# Altium project pca20072.PrjPCB (part 1 of 2)
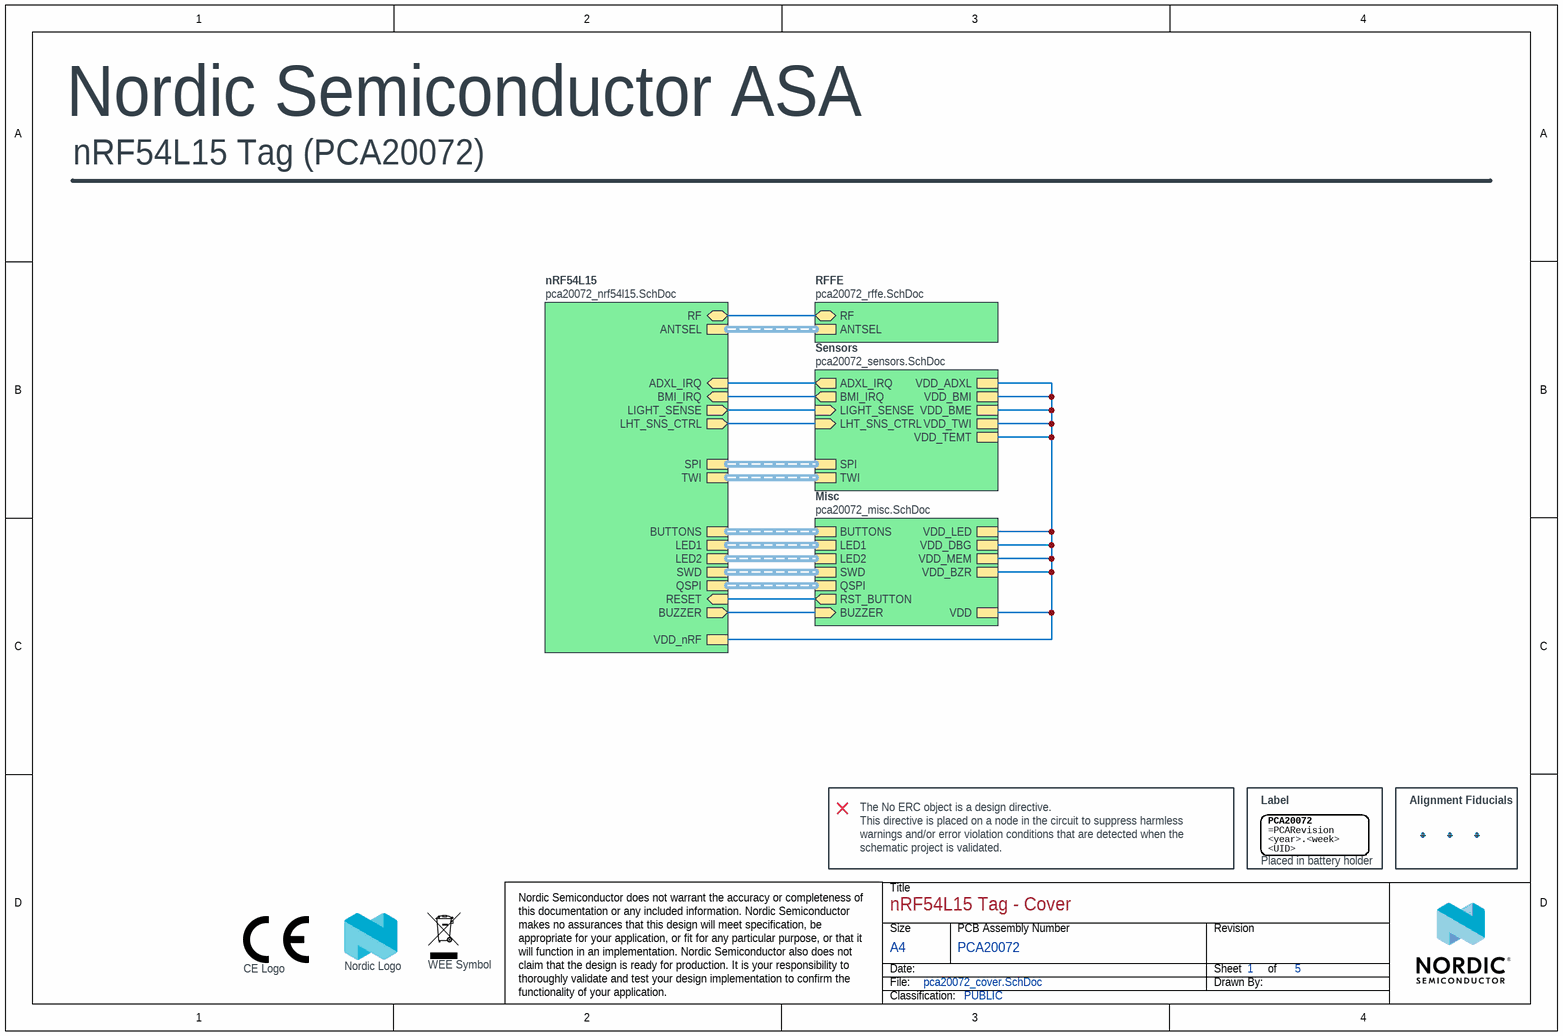
[diagram p0: pca20072_cover.SchDoc]
BoardThickness: 0.8mm; BoardTitle: nRF54L15 Tag; Classification: PUBLIC; Compliance: RoHS, REACH, Halogen-Free; Designer: RUBR; Dielectric: FR-4; NrOfLayers: 4; Organization: Nordic Semiconductor; PCAName: PCA20072; PCARevision: 1.0.0; PCBNumber: 400921; PCBRevision: 0491RUBR; PCBStackup: 4003; ProductName: nRF54L15-TAG; ProjectName: nRF54L15-TAG; SilkscreenColor: White; SoldermaskColor: Blue; SurfaceFinish: ENIG Gold
5 sheets, 113 parts. Net scope: hierarchical (ports join the sheet entries above them; power ports are global).
Board file: 400921.PcbDoc
Sheets:
  pca20072_cover.SchDoc
    nRF54L15 = pca20072_nrf54l15.SchDoc
    RFFE = pca20072_rffe.SchDoc
    Sensors = pca20072_sensors.SchDoc
    Misc = pca20072_misc.SchDoc

## Sheet pca20072_cover.SchDoc: nRF54L15 Tag - Cover
size A4; Organization: Nordic Semiconductor; DocumentNumber: 1; Revision: 1.0.0; SheetNumber: 1; SheetTotal: 5; Author: RUBR; CompanyName: Nordic Semiconductor; DrawnBy: RUBR; DocumentSize: A4; ProjectName: nRF54L15-TAG

### Parts
Fid1  Fiducial mark  [Fiducial]  (value not drawn)
Fid2  Fiducial mark  [Fiducial]  (value not drawn)
Fid3  Fiducial mark  [Fiducial]  (value not drawn)
LABEL1  Assembly: Placed in battery holder  [LabelSilk_8x8]  (hidden comment: 8x8mm)
LOGO1  WEE Symbol  [WEEE_3x4.5mm]  (no BOM)
LOGO2  Nordic Logo  [NORDIC_LOGO_LYING]  (no BOM)
LOGO3  CE Logo  [CE_logo]  (no BOM)

### Blocks framed on the sheet
Label: LABEL1
Alignment Fiducials: Fid1-Fid3

### Sub-sheets
Misc = pca20072_misc.SchDoc: BUTTONS (harness BUTTON), QSPI (harness QSPI), LED1 (harness LED), SWD (harness SWD), VDD_MEM, VDD_LED, VDD_DBG, LED2 (harness LED), BUZZER (in), VDD_BZR, RST_BUTTON (out), VDD
nRF54L15 = pca20072_nrf54l15.SchDoc: BUTTONS (harness BUTTON), LED1 (harness LED), SWD (harness SWD), RESET (in), RF (bidir), ANTSEL (harness ANT), QSPI (harness QSPI), ADXL_IRQ (in), BMI_IRQ (in), SPI (harness SPI), TWI (harness TWI), VDD_nRF, LHT_SNS_CTRL (out), LED2 (harness LED), LIGHT_SENSE (out), BUZZER (out)
RFFE = pca20072_rffe.SchDoc: RF (bidir), ANTSEL (harness ANT)
Sensors = pca20072_sensors.SchDoc: ADXL_IRQ (out), BMI_IRQ (out), SPI (harness SPI), TWI (harness TWI), VDD_BMI, VDD_ADXL, VDD_BME, VDD_TWI, LIGHT_SENSE (in), LHT_SNS_CTRL (in), VDD_TEMT

### Nets
P0.03: sheet nRF54L15/ADXL_IRQ, sheet Sensors/ADXL_IRQ
P1.04: sheet nRF54L15/BMI_IRQ, sheet Sensors/BMI_IRQ
P1.13: sheet nRF54L15/BUZZER, sheet Misc/BUZZER
P1.14: sheet nRF54L15/LIGHT_SENSE, sheet Sensors/LIGHT_SENSE
P2.06: sheet nRF54L15/LHT_SNS_CTRL, sheet Sensors/LHT_SNS_CTRL
RESET: sheet nRF54L15/RESET, sheet Misc/RST_BUTTON
RF: sheet nRF54L15/RF, sheet RFFE/RF
VDD: sheet nRF54L15/VDD_nRF, sheet Sensors/VDD_BMI, sheet Sensors/VDD_ADXL, sheet Sensors/VDD_BME, sheet Sensors/VDD_TWI, sheet Sensors/VDD_TEMT, sheet Misc/VDD_MEM, sheet Misc/VDD_LED, sheet Misc/VDD_DBG, sheet Misc/VDD_BZR, sheet Misc/VDD

### Buses and harness runs
harness sheet Misc/BUTTONS = sheet nRF54L15/BUTTONS
harness sheet Misc/LED1 = sheet nRF54L15/LED1
harness sheet Misc/LED2 = sheet nRF54L15/LED2
harness sheet Misc/QSPI = sheet nRF54L15/QSPI
harness sheet Misc/SWD = sheet nRF54L15/SWD
harness sheet nRF54L15/ANTSEL = sheet RFFE/ANTSEL
harness sheet nRF54L15/SPI = sheet Sensors/SPI
harness sheet nRF54L15/TWI = sheet Sensors/TWI

### Notes on the sheet
- (near LABEL1) The No ERC object is a design directive.
  This directive is placed on a node in the circuit to suppress harmless warnings and/or error violation conditions that are detected when the schematic project is validated.
- Nordic Semiconductor ASA
- Title
- Size
- Date:
- File:
- A4
- PCB Assembly Number
- Sheet
- Drawn By:
- Revision
- of
- Nordic Semiconductor does not warrant the accuracy or completeness of this documentation or any included information. Nordic Semiconductor makes no assurances that this design will meet specification, be appropriate for your application, or fit for any particular purpose, or that it will function in an implementation. Nordic Semiconductor also does not claim that the design is ready for production. It is your responsibility to thoroughly validate and test your design implementation to confirm the functionality of your application.
  © Nordic Semiconductor — All rights reserved.
- Classification:
- (in symbol Label_8x8) <year>.<week>; <UID>

### Library data of the parts
Fid1-Fid3 = Fid-Mark: Manufacturer: N.A.; Part number NEMS: 100500073; Value: N.A.; Pad Count: 1; Component Status: Active; System: Connector; Part Number: Fid-Mark; Manufacturer Part Number: N.A.; LatestRevisionDate: 2009-12-12; Published: 2009-12-12; Note: N.A.; Artikkelnr Noca: N.A.; Footprint Doc: Fiducial; PartId: 100500073; Component Class: Connectors; Author: rsk; ComponentLink1URL: N.A.; ComponentLink1Description: Datasheet; ComponentLink2URL: N.A.; ComponentLink2Description: Supplier link; HelpURL: N.A.; Supplier 1: N.A.; Supplier Part Number 1: N.A.; Supplier 2: N.A.; Supplier Part Number 2: N.A.; Part number IPS: N.A.; Part number Norautron: N.A.
LABEL1 = Label_8x8: PCA version label, stick-on, 8x8mm; Manufacturer: Ellco Etikett; Manufacturer Part Number: A33511-01; Part number NEMS: 101200025; Component Status: Active; Pad Count: 0; Note: N.A.; Part Number: Label_8x8; PartId: 101200025; Component Class: Mechanicals; Author: hany; ComponentLink1URL: N.A.; ComponentLink1Description: Datasheet; ComponentLink2URL: N.A.; ComponentLink2Description: Supplier link; HelpURL: N.A.; LatestRevisionDate: 2023-01-05; Published: 2023-01-05; Footprint Doc: Label; Value: 8x8mm; Supplier 1: N.A.; Supplier Part Number 1: N.A.; Supplier 2: N.A.; Supplier Part Number 2: N.A.; Artikkelnr Noca: N.A.; Part number IPS: N.A.; Part number Norautron: N.A.
LOGO1 = WEEE Symbol 3x4.5mm: WEEE Directive symbol; Manufacturer: N.A.; Part number NEMS: 101100006; Component Status: Active; Pad Count: 0; Part Number: WEEE Symbol 3x4.5mm; PartId: 101100006; Component Class: Markings; Author: rsk; Manufacturer Part Number: N.A.; ComponentLink1URL: N.A.; ComponentLink1Description: Datasheet; ComponentLink2URL: N.A.; ComponentLink2Description: Supplier link; HelpURL: N.A.; LatestRevisionDate: 2023-03-07; Published: 2016-09-07; Footprint Doc: WEEE_3x4.5mm; Value: WEE Symbol; Note: N.A.; Supplier 1: N.A.; Supplier Part Number 1: N.A.; Supplier 2: N.A.; Supplier Part Number 2: N.A.; Artikkelnr Noca: N.A.; Part number IPS: N.A.; Part number Norautron: N.A.
LOGO2 = Nordic Logo lying: Manufacturer: N.A.; Part number NEMS: 101100001; Component Status: Active; Pad Count: 0; Part Number: Nordic Logo lying; PartId: 101100001; Component Class: Markings; Author: rsk; Manufacturer Part Number: N.A.; ComponentLink1URL: N.A.; ComponentLink1Description: Datasheet; ComponentLink2URL: N.A.; ComponentLink2Description: Supplier link; HelpURL: N.A.; LatestRevisionDate: 2017-03-20; Published: 2017-09-01; Footprint Doc: Nordic Logo; Value: Nordic Logo; Note: N.A.; Supplier 1: N.A.; Supplier Part Number 1: N.A.; Supplier 2: N.A.; Supplier Part Number 2: N.A.; Artikkelnr Noca: N.A.; Part number IPS: N.A.; Part number Norautron: N.A.
LOGO3 = CE_logo: CE (Conformité_Européenne) logo; Manufacturer: N.A.; Part number NEMS: 101100010; Component Status: Active; Pad Count: 0; Part Number: CE_logo; PartId: 101100010; Component Class: Markings; Author: daba; Manufacturer Part Number: N.A.; ComponentLink1URL: N.A.; ComponentLink1Description: Datasheet; ComponentLink2URL: N.A.; ComponentLink2Description: Supplier link; HelpURL: N.A.; LatestRevisionDate: 2024-11-26; Published: 2024-11-26; Footprint Doc: CE_logo; Value: CE Logo; Note: N.A.; Supplier 1: N.A.; Supplier Part Number 1: N.A.; Supplier 2: N.A.; Supplier Part Number 2: N.A.; Artikkelnr Noca: N.A.; Part number IPS: N.A.; Part number Norautron: N.A.

## Sheet pca20072_nrf54l15.SchDoc: =BoardTitle+' - nRF54L15'
size A4; Organization: Nordic Semiconductor; DocumentNumber: 2; Revision: 1.0.0; SheetNumber: 2; SheetTotal: 5; Author: RUBR; CompanyName: Nordic Semiconductor; DrawnBy: RUBR; DocumentSize: A4; ProjectName: nRF54L15-TAG
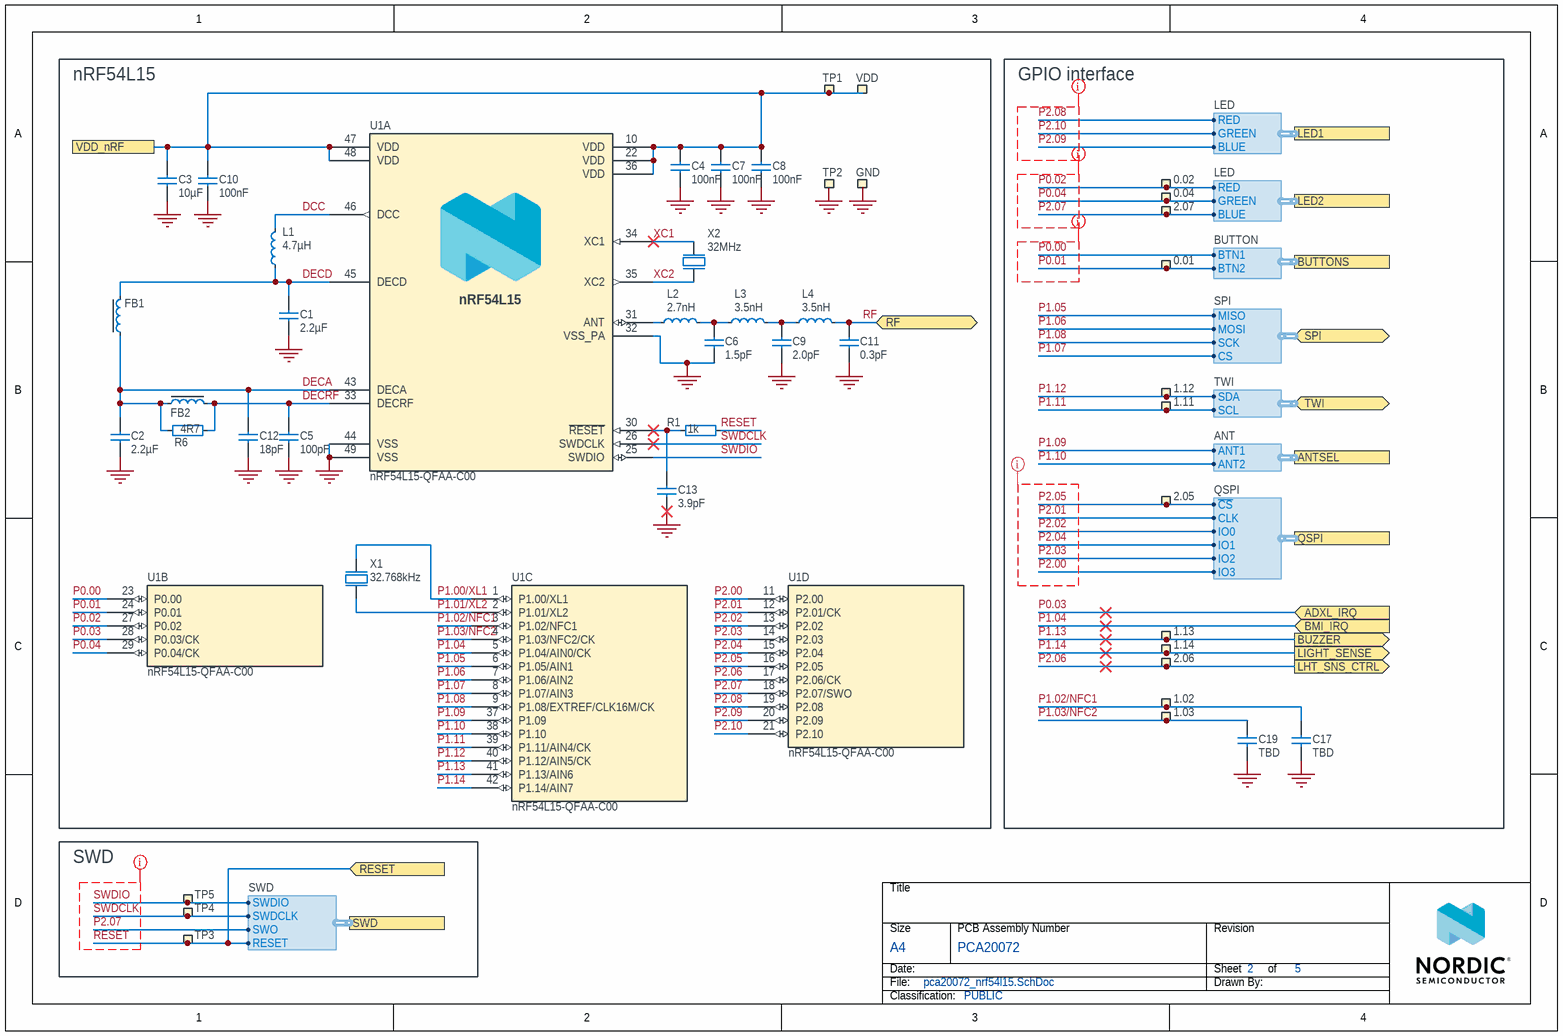
[diagram p1: pca20072_nrf54l15.SchDoc]

### Parts
0.01  TP  [TESTPAD-TH]  (value not drawn)  (no BOM)
0.02  TP  [TESTPAD-TH]  (value not drawn)  (no BOM)
0.04  TP  [TESTPAD-TH]  (value not drawn)  (no BOM)
1.02  TP  [TESTPAD-TH]  (value not drawn)  (no BOM)
1.03  TP  [TESTPAD-TH]  (value not drawn)  (no BOM)
1.11  TP  [TESTPAD-TH]  (value not drawn)  (no BOM)
1.12  TP  [TESTPAD-TH]  (value not drawn)  (no BOM)
1.13  TP  [TESTPAD-TH]  (value not drawn)  (no BOM)
1.14  TP  [TESTPAD-TH]  (value not drawn)  (no BOM)
2.05  TP  [TESTPAD-TH]  (value not drawn)  (no BOM)
2.06  TP  [TESTPAD-TH]  (value not drawn)  (no BOM)
2.07  TP  [TESTPAD-TH]  (value not drawn)  (no BOM)
C1  2.2µF  [CAPC0603X03L_C]
C2  2.2µF  [CAPC0603X03L_C]
C3  10µF  [CAPC1005X04L_C2]
C4  100nF  [CAPC0603X03L_C]
C5  100pF  [CAPC0603X03L_C]
C6  1.5pF  [CAPC0603X03L_C]
C7  100nF  [CAPC0603X03L_C]
C8  100nF  [CAPC0603X03L_C]
C9  2.0pF  [CAPC0603X03L_C]
C10  100nF  [CAPC0603X03L_C]
C11  0.3pF  [CAPC0603X03L_C]
C12  18pF  [CAPC0603X03L_C]
C13  3.9pF  [CAPC0603X03L_C]
C17  TBD  [CAPC1005X04L]
C19  TBD  [CAPC1005X04L]
FB1  120R/0.2A  [INDC0603X03L_C]  (value not drawn)
FB2  120R/0.2A  [INDC0603X03L_C]  (value not drawn)
GND  TP  [TESTPAD-TH]  (value not drawn)  (no BOM)
L1  4.7µH  [INDC1608X06L]
L2  2.7nH  [INDC0603X03L_C]
L3  3.5nH  [INDC0603X03L_C]
L4  3.5nH  [INDC0603X03L_C]
R1  1k  [RESC0603X03L_C]
R6  4R7  [RESC0603X03L_C]
TP1  Ø1.5mm,SMD  [TP_SMD_D1.5mm]  (value not drawn)  (no BOM)
TP2  Ø1.5mm,SMD  [TP_SMD_D1.5mm]  (value not drawn)  (no BOM)
TP3  Ø1.5mm,SMD  [TP_SMD_D1.5mm]  (value not drawn)  (no BOM)
TP4  Ø1.5mm,SMD  [TP_SMD_D1.5mm]  (value not drawn)  (no BOM)
TP5  Ø1.5mm,SMD  [TP_SMD_D1.5mm]  (value not drawn)  (no BOM)
U1  nRF54L15-QFAA-C00  [QFN40P600X600X90-48N]  (parts A,B,C,D of 4)
VDD  TP  [TESTPAD-TH]  (value not drawn)  (no BOM)
X1  32.768kHz  [XTAL_2012]
X2  32MHz  [BT-XTAL_2016]

### Blocks framed on the sheet
nRF54L15: C1-C13 FB1 FB2 GND L1-L4 R1 R6 TP1 TP2 U1 VDD X1 X2
GPIO interface: 0.01 0.02 0.04 1.02 1.03 1.11-1.14 2.05 2.06 2.07 C17 C19
SWD: TP3-TP5

### Ports
ADXL_IRQ (in), ANTSEL (harness ANT), BMI_IRQ (in), BUTTONS (harness BUTTON), BUZZER (out), LED1 (harness LED), LED2 (harness LED), LHT_SNS_CTRL (out), LIGHT_SENSE (out), QSPI (harness QSPI), RESET (in), RF (bidir), SPI (bidir, harness SPI), SWD (harness SWD), TWI (bidir, harness TWI), VDD_nRF

### Harnesses
SWD: SWDIO, SWDCLK, SWO, RESET
LED: GREEN, RED, BLUE
BUTTON: BTN2, BTN1
ANT: ANT2, ANT1
QSPI: ~{CS}, IO0, CLK, IO1, IO2, IO3
SPI: MISO, MOSI, SCK, CS
TWI: SCL, SDA

### Nets
GND: C1.1 C2.1 C3.1 C4.2 C5.1 C6.1 C7.2 C8.2 C9.1 C10.2 C11.1 C12.1 C13.1 C17.2 C19.2 GND.1 TP2.1 U1.32(VSS_PA) U1.44(VSS) U1.49(VSS) X2.2(GND) X2.4(GND)
DCC: L1.1 U1.46(DCC)
DECA: C2.2 C12.2 FB1.2 FB2.2 R6.2 U1.43(DECA)
DECD: C1.2 FB1.1 L1.2 U1.45(DECD)
DECRF: C5.2 FB2.1 R6.1 U1.33(DECRF)
P0.00: U1.23(P0.00) ; port BUTTONS.BTN1
P0.01: 0.01.1 U1.24(P0.01) ; port BUTTONS.BTN2
P0.02: 0.02.1 U1.27(P0.02) ; port LED2.RED
P0.03: U1.28(P0.03/CK) ; port ADXL_IRQ
P0.04: 0.04.1 U1.29(P0.04/CK) ; port LED2.GREEN
P1.00/XL1: U1.1(P1.00/XL1) X1.2(out)
P1.01/XL2: U1.2(P1.01/XL2) X1.1(inp)
P1.02/NFC1: 1.02.1 C17.1 U1.3(P1.02/NFC1)
P1.03/NFC2: 1.03.1 C19.1 U1.4(P1.03/NFC2/CK)
P1.04: U1.5(P1.04/AIN0/CK) ; port BMI_IRQ
P1.05: U1.6(P1.05/AIN1) ; port SPI.MISO
P1.06: U1.7(P1.06/AIN2) ; port SPI.MOSI
P1.07: U1.8(P1.07/AIN3) ; port SPI.CS
P1.08: U1.9(P1.08/EXTREF/CLK16M/CK) ; port SPI.SCK
P1.09: U1.37(P1.09) ; port ANTSEL.ANT1
P1.10: U1.38(P1.10) ; port ANTSEL.ANT2
P1.11: 1.11.1 U1.39(P1.11/AIN4/CK) ; port TWI.SCL
P1.12: 1.12.1 U1.40(P1.12/AIN5/CK) ; port TWI.SDA
P1.13: 1.13.1 U1.41(P1.13/AIN6) ; port BUZZER
P1.14: 1.14.1 U1.42(P1.14/AIN7) ; port LIGHT_SENSE
P2.00: U1.11(P2.00) ; port QSPI.IO3
P2.01: U1.12(P2.01/CK) ; port QSPI.CLK
P2.02: U1.13(P2.02) ; port QSPI.IO0
P2.03: U1.14(P2.03) ; port QSPI.IO2
P2.04: U1.15(P2.04) ; port QSPI.IO1
P2.05: 2.05.1 U1.16(P2.05) ; port QSPI.~{CS}
P2.06: 2.06.1 U1.17(P2.06/CK) ; port LHT_SNS_CTRL
P2.07: 2.07.1 U1.18(P2.07/SWO) ; port SWD.SWO, port LED2.BLUE
P2.08: U1.19(P2.08) ; port LED1.RED
P2.09: U1.20(P2.09) ; port LED1.BLUE
P2.10: U1.21(P2.10) ; port LED1.GREEN
RESET: R1.2 TP3.1 ; port RESET, port SWD.RESET
RF: C11.2 L4.2 ; port RF
SWDCLK: TP4.1 U1.26(SWDCLK) ; port SWD.SWDCLK
SWDIO: TP5.1 U1.25(SWDIO) ; port SWD.SWDIO
VDD: C3.2 C4.1 C7.1 C8.1 C10.1 TP1.1 U1.10(VDD) U1.22(VDD) U1.36(VDD) U1.47(VDD) U1.48(VDD) VDD.1 ; port VDD_nRF
XC1: U1.34(XC1) X2.1(inp)
XC2: U1.35(XC2) X2.3(out)
NetC6_2: C6.2 L2.2 L3.1
NetC9_2: C9.2 L3.2 L4.1
NetC13_2: C13.2 R1.1 U1.30(~{RESET})
NetL2_1: L2.1 U1.31(ANT)

### Layout directives
net class GPIO: P0.00, P0.01, P0.02, P0.04, P2.07, P2.08, P2.09, P2.10
net class SWD_nRF54: P2.07, RESET, SWDCLK, SWDIO
net class QSPI: P2.00, P2.01, P2.02, P2.03, P2.04, P2.05

### Notes on the sheet
- Title
- Size
- Date:
- File:
- A4
- PCB Assembly Number
- Sheet
- Drawn By:
- Revision
- of
- Classification:
- (in symbol nRF54L15-QFAA-C00, part A) nRF54L15

### Library data of the parts
0.01 0.02 0.04 1.02 1.03 1.11-1.14 2.05 2.06 2.07 GND VDD = Testpoint TH: Testpoint, through hole; Manufacturer: N.A.; Part number NEMS: 100500464; Component Status: Active; Pad Count: 1; Part Number: Testpoint TH; PartId: 100500464; Component Class: Connectors; Author: rsk; Manufacturer Part Number: N.A.; ComponentLink1URL: N.A.; ComponentLink1Description: Datasheet; ComponentLink2URL: N.A.; ComponentLink2Description: Supplier link; HelpURL: N.A.; LatestRevisionDate: 2009-12-12; Published: 2009-12-12; Footprint Doc: TESTPAD-TH; Value: TP; Note: N.A.; Supplier 1: N.A.; Supplier Part Number 1: N.A.; Supplier 2: N.A.; Supplier Part Number 2: N.A.; Artikkelnr Noca: N.A.; Part number IPS: N.A.; Part number Norautron: N.A.
C1 C2 = C0201-2µ2-2.5V-X6T-GRM033D80E225ME47D: Capacitor, Ceramic, 2.2µF 2.5V X6T 0201,±20%; Manufacturer: Murata; Part number NEMS: 100200527; Component Status: Active; Pad Count: 2; Note: 2.5V, 20%, X6T; Artikkelnr Noca: N.A.; Part Number: C0201-2µ2-2.5V-X6T-GRM033D80E225ME47D; Component Class: Capacitors; Author: stl1; Manufacturer Part Number: GRM033D80E225ME47D; ComponentLink1URL: https://www.murata.com/products/productdetail?partno=GRM033D80E225ME47%23; ComponentLink1Description: Datasheet; ComponentLink2URL: N.A.; ComponentLink2Description: Supplier link; HelpURL: N.A.; LatestRevisionDate: 2022-02-27; Published: 2022-02-27; Footprint Doc: 0201; Value: 2.2µF; Supplier 1: Mouser; Supplier Part Number 1: 81-GRM033D80E225ME7D; Supplier 2: DigiKey; Supplier Part Number 2: 490-18653-1-ND; Part number IPS: N.A.; Part number Norautron: N.A.; PartId: 100200527
C3 = C0402-10µ-6.3V-X5R-GRM155R60J106ME05D: Capacitor, X5R, ±20%, 6.3V; Manufacturer: Murata; Part number NEMS: 100200554; Component Status: Active; Pad Count: 2; Artikkelnr Noca: N.A.; Part Number: C0402-10µ-6.3V-X5R-GRM155R60J106ME05D; PartId: 100200554; Component Class: Capacitors; Author: eisk; Manufacturer Part Number: GRM155R60J106ME05D; ComponentLink1URL: https://www.murata.com/products/productdetail?partno=GRM155R60J106ME05%23; ComponentLink1Description: Datasheet; ComponentLink2URL: N.A.; ComponentLink2Description: Supplier link; HelpURL: https://www.murata.com/products/productdetail?partno=GRM155R60J106ME05%23; LatestRevisionDate: 2023-08-01; Published: 2023-08-01; Footprint Doc: 0402; Value: 10µF; Note: 6.3V; Supplier 1: DigiKey; Supplier Part Number 1: 490-GRM155R60J106ME05DTR-ND; Supplier 2: Mouser; Supplier Part Number 2: 81-GRM155C81C225KE1D; Part number IPS: N.A.; Part number Norautron: N.A.
C4 C7 C8 C10 = C0201-100n: Capacitor, X5R, ±10%, 100nF, 16V; Manufacturer: N.A.; Part number IPS: 00000001248, 00000002505; Part number Norautron: 262071862; Part number NEMS: 100200078; Pad Count: 2; Component Status: Active; Part Number: C0201-100n; Manufacturer Part Number: N.A.; Footprint Doc: 0201; LatestRevisionDate: 2024-06-27; Published: 2014-11-13; Value: 100nF; Note: 16V; Artikkelnr Noca: N.A.; ComponentLink1URL: N.A.; ComponentLink1Description: Datasheet; ComponentLink2URL: N.A.; ComponentLink2Description: Supplier link; HelpURL: N.A.; Supplier 1: N.A.; Supplier Part Number 1: N.A.; Supplier 2: N.A.; Supplier Part Number 2: N.A.; Component Class: Capacitors; Author: rsk; PartId: 100200078
C5 = C0201-100p: Capacitor, NP0, ±2%, 25V; Manufacturer: Murata; Manufacturer Part Number: GRM0335C1E101GA01D; Part number IPS: 00000007853; Part number NEMS: 100200044; Component Status: Active; Pad Count: 2; Artikkelnr Noca: N.A.; Part Number: C0201-100p; PartId: 100200044; Component Class: Capacitors; Author: rsk; ComponentLink1URL: N.A.; ComponentLink1Description: Datasheet; ComponentLink2URL: N.A.; ComponentLink2Description: Supplier link; HelpURL: N.A.; LatestRevisionDate: 2019-04-16; Published: 2019-04-16; Footprint Doc: 0201; Value: 100pF; Note: 25V; Supplier 1: N.A.; Supplier Part Number 1: N.A.; Supplier 2: N.A.; Supplier Part Number 2: N.A.; Part number Norautron: N.A.
C6 = C0201-1.5p-25V-NP0-GJM0335C1E1R5WB01: Capacitor, NP0, ±0.05pF, 25V, High Q; Manufacturer: Murata; Part number NEMS: 100200477; Component Status: Active; Pad Count: 2; Artikkelnr Noca: N.A.; Part Number: C0201-1.5p-25V-NP0-GJM0335C1E1R5WB01; PartId: 100200477; Component Class: Capacitors; Author: masi; Manufacturer Part Number: GJM0335C1E1R5WB01; ComponentLink1URL: https://search.murata.co.jp/Ceramy/image/img/A01X/G101/ENG/GJM0335C1E1R5WB01-01.pdf; ComponentLink1Description: Datasheet; ComponentLink2URL: N.A.; ComponentLink2Description: Supplier link; HelpURL: https://www.murata.com/products/productdetail?partno=GJM0335C1E1R5WB01%23; LatestRevisionDate: 2021-06-15; Published: 2021-06-15; Footprint Doc: 0201; Value: 1.5pF; Note: 25V; Supplier 1: DigiKey; Supplier Part Number 1: 490-11176-2-ND; Supplier 2: Mouser; Supplier Part Number 2: 81-GJM0335C1E1R5WB1D; Part number IPS: N.A.; Part number Norautron: N.A.
C9 = C0201-2.0p-HQ-Murata: Capacitor, NP0, ±0.05pF, 25V; Manufacturer: Murata; Manufacturer Part Number: GJM0335C1E2R0WB01; Part number IPS: 00000001775; Part number NEMS: 100200419; Component Status: Active; Pad Count: 2; Artikkelnr Noca: N.A.; Part Number: C0201-2.0p-HQ-Murata; PartId: 100200419; Component Class: Capacitors; Author: rsk; ComponentLink1URL: N.A.; ComponentLink1Description: Datasheet; ComponentLink2URL: N.A.; ComponentLink2Description: Supplier link; HelpURL: https://psearch.en.murata.com/capacitor/product/GJM0335C1E2R0WB01%23.html; LatestRevisionDate: 2018-10-25; Published: 2018-10-25; Footprint Doc: 0201; Value: 2.0pF; Note: 25V; Supplier 1: N.A.; Supplier Part Number 1: N.A.; Supplier 2: N.A.; Supplier Part Number 2: N.A.; Part number Norautron: N.A.
C11 = C0201-0.3p-50V-GRM0335C1HR30BA01: Capacitor, C0G, ±0.1pF, 50V; Manufacturer: Murata; Part number NEMS: 100200650; Component Status: Active; Pad Count: 2; Artikkelnr Noca: N.A.; Part Number: C0201-0.3p-50V-GRM0335C1HR30BA01; PartId: 100200650; Component Class: Capacitors; Author: masi; Manufacturer Part Number: GRM0335C1HR30BA01; ComponentLink1URL: https://www.murata.com/en-global/products/productdetail?partno=GRM0335C1HR30BA01%23; ComponentLink1Description: Datasheet; ComponentLink2URL: N.A.; ComponentLink2Description: Supplier link; HelpURL: N.A.; LatestRevisionDate: 2024-01-10; Published: 2024-01-10; Footprint Doc: 0201; Value: 0.3pF; Note: 50V; Supplier 1: DigiKey; Supplier Part Number 1: 490-6135-2-ND; Supplier 2: Mouser; Supplier Part Number 2: 81-GRM0335C1HR30BA1D; Part number IPS: N.A.; Part number Norautron: N.A.
C12 = C0201-18p: Capacitor, C0G, ±5%, 25V; Manufacturer: Walsin Technology Corporation; Manufacturer Part Number: 0201N180J250CT; Part number IPS: 00000000862; Part number Norautron: 26207023; Part number NEMS: 100200035; Component Status: Active; Pad Count: 2; Note: Chip Cap 5%; Artikkelnr Noca: N.A.; Part Number: C0201-18p; PartId: 100200035; Component Class: Capacitors; Author: rsk; ComponentLink1URL: N.A.; ComponentLink1Description: Datasheet; ComponentLink2URL: N.A.; ComponentLink2Description: Supplier link; HelpURL: N.A.; LatestRevisionDate: 2020-10-13; Published: 2014-11-13; Footprint Doc: 0201; Value: 18pF; Supplier 1: N.A.; Supplier Part Number 1: N.A.; Supplier 2: N.A.; Supplier Part Number 2: N.A.
C13 = C0201-3.9p: Chip Cap 0201; Manufacturer: N.A.; Part number NEMS: 100200024,100200424; Component Status: Active; Pad Count: 2; Note: Chip Cap 1%; Part Number: C0201-3.9p; PartId: 100200024; Component Class: Capacitors; Author: rsk; Manufacturer Part Number: N.A.; ComponentLink1URL: N.A.; ComponentLink1Description: Datasheet; ComponentLink2URL: N.A.; ComponentLink2Description: Supplier link; HelpURL: N.A.; LatestRevisionDate: 2014-11-13; Published: 2014-11-13; Footprint Doc: 0201; Value: 3.9pF; Supplier 1: N.A.; Supplier Part Number 1: N.A.; Supplier 2: N.A.; Supplier Part Number 2: N.A.; Artikkelnr Noca: N.A.; Part number IPS: N.A.; Part number Norautron: N.A.
C17 C19 = C0402-TBD: Chip Cap 0402; Manufacturer: N.A.; Part number NEMS: 100200106; Pad Count: 2; Component Status: Active; Part Number: C0402-TBD; Manufacturer Part Number: N.A.; Footprint Doc: 0402; LatestRevisionDate: 2010-12-21; Published: 2010-12-21; Value: TBD; Note: Chip Cap; Artikkelnr Noca: N.A.; Part number IPS: N.A.; ComponentLink1URL: N.A.; ComponentLink1Description: Datasheet; ComponentLink2URL: N.A.; ComponentLink2Description: Supplier link; HelpURL: N.A.; Supplier 1: N.A.; Supplier Part Number 1: N.A.; Supplier 2: N.A.; Supplier Part Number 2: N.A.; Component Class: Capacitors; PartId: 100200106; Author: rsk; Part number Norautron: N.A.
FB1 FB2 = FB0201-120R@100M-200mA-BLM03AG121SN1D: Ferrite Bead, 120 Ohm @ 100MHz, 200mA, 500 mOhm Max; Manufacturer: Murata; Part number NEMS: 100300419; Component Status: Active; Pad Count: 2; Artikkelnr Noca: N.A.; Part Number: FB0201-120R@100M-200mA-BLM03AG121SN1D; Component Class: Inductors; Author: stl1; Manufacturer Part Number: BLM03AG121SN1D; ComponentLink1URL: https://www.murata.com/en-eu/products/productdetail?partno=BLM03AG121SN1%23; ComponentLink1Description: Datasheet; ComponentLink2URL: N.A.; ComponentLink2Description: Supplier link; HelpURL: N.A.; LatestRevisionDate: 2022-02-27; Published: 2022-02-27; Footprint Doc: 0201; Value: 120R/0.2A; Note: Ferrite Bead; Supplier 1: DigiKey; Supplier Part Number 1: 490-5622-1-ND; Supplier 2: Mouser; Supplier Part Number 2: 81-BLM03AX121SN1D; Part number IPS: N.A.; Part number Norautron: N.A.; PartId: 100300419
L1 = L0603-4µ7-MLZ1608M4R7WT000: Inductor, 120mA, ±20%, 0.65R; Manufacturer: TDK Corporation; Part number NEMS: 100300440; Component Status: Active; Pad Count: 2; Note: Power Inductor ±20%; Artikkelnr Noca: N.A.; Part Number: L0603-4µ7-MLZ1608M4R7WT000; PartId: 100300440; Component Class: Inductors; Author: stl1; Manufacturer Part Number: MLZ1608M4R7WT000; ComponentLink1URL: https://product.tdk.com/en/search/inductor/inductor/smd/info?part_no=MLZ1608M4R7WT000; ComponentLink1Description: Datasheet; ComponentLink2URL: N.A.; ComponentLink2Description: Supplier link; HelpURL: N.A.; LatestRevisionDate: 2023-05-10; Published: 2023-05-10; Footprint Doc: 0603; Value: 4.7µH; Supplier 1: DigiKey; Supplier Part Number 1: 445-6390-2-ND; Supplier 2: Mouser; Supplier Part Number 2: 810-MLZ1608M4R7WT000; Part number IPS: N.A.; Part number Norautron: N.A.
L2 = L0201-2n7-HQ-Murata: Inductor, 600mA, ±0.1ｎH, 120mOhm; Manufacturer: Murata; Manufacturer Part Number: LQP03HQ2N7B02; Part number IPS: 00000001753; Part number NEMS: 100300214; Component Status: Active; Pad Count: 2; Note: -55°C ~ 125°C; Artikkelnr Noca: N.A.; Part Number: L0201-2n7-HQ-Murata; PartId: 100300214; Component Class: Inductors; Author: rsk; ComponentLink1URL: https://search.murata.co.jp/Ceramy/image/img/P02/JELF243C-0021.pdf; ComponentLink1Description: Datasheet; ComponentLink2URL: N.A.; ComponentLink2Description: Supplier link; HelpURL: https://psearch.en.murata.com/inductor/product/LQP03HQ2N7B02%23.html; LatestRevisionDate: 2018-10-23; Published: 2018-10-23; Footprint Doc: 0201; Value: 2.7nH; Supplier 1: DigiKey; Supplier Part Number 1: 490-13909-1-ND; Supplier 2: N.A.; Supplier Part Number 2: N.A.; Part number Norautron: N.A.
L3 L4 = L0201-3n5-HQ-Murata: Inductor, 500mA, ±0.1ｎH, 170mOhm; Manufacturer: Murata; Manufacturer Part Number: LQP03HQ3N5B02; Part number NEMS: 100300222; Component Status: Active; Pad Count: 2; Note: -55°C ~ 125°C; Artikkelnr Noca: N.A.; Part Number: L0201-3n5-HQ-Murata; PartId: 100300222; Component Class: Inductors; Author: rsk; ComponentLink1URL: https://search.murata.co.jp/Ceramy/image/img/P02/JELF243C-0021.pdf; ComponentLink1Description: Datasheet; ComponentLink2URL: N.A.; ComponentLink2Description: Supplier link; HelpURL: https://psearch.en.murata.com/inductor/product/LQP03HQ3N5B02%23.html; LatestRevisionDate: 2018-10-23; Published: 2018-10-23; Footprint Doc: 0201; Value: 3.5nH; Supplier 1: DigiKey; Supplier Part Number 1: 490-13925-1-ND; Supplier 2: N.A.; Supplier Part Number 2: N.A.; Part number IPS: N.A.; Part number Norautron: N.A.
R1 = R0201-1k0: Resistor, ±1%, 0.05W; Manufacturer: N.A.; Part number IPS: 00000005786; Part number NEMS: 100100043; Component Status: Active; Pad Count: 2; Note: Chip Res 1%; Part Number: R0201-1k0; PartId: 100100043; Component Class: Resistors; Author: rsk; Manufacturer Part Number: N.A.; ComponentLink1URL: N.A.; ComponentLink1Description: Datasheet; ComponentLink2URL: N.A.; ComponentLink2Description: Supplier link; HelpURL: N.A.; LatestRevisionDate: 2014-11-13; Published: 2014-11-13; Footprint Doc: 0201; Value: 1k; Supplier 1: N.A.; Supplier Part Number 1: N.A.; Supplier 2: N.A.; Supplier Part Number 2: N.A.; Artikkelnr Noca: N.A.; Part number Norautron: N.A.
R6 = R0201-4R7: Resistor, ±1%, 0.05W; Manufacturer: N.A.; Part number IPS: 00000002486; Part number NEMS: 100100010; Component Status: Active; Pad Count: 2; Note: Chip Res 1%; Part Number: R0201-4R7; PartId: 100100010; Component Class: Resistors; Author: rsk; Manufacturer Part Number: N.A.; ComponentLink1URL: N.A.; ComponentLink1Description: Datasheet; ComponentLink2URL: N.A.; ComponentLink2Description: Supplier link; HelpURL: N.A.; LatestRevisionDate: 2014-11-13; Published: 2014-11-13; Footprint Doc: 0201; Value: 4R7; Supplier 1: N.A.; Supplier Part Number 1: N.A.; Supplier 2: N.A.; Supplier Part Number 2: N.A.; Artikkelnr Noca: N.A.; Part number Norautron: N.A.
TP1-TP5 = TP_SMD_Ø1.5MM: 1.5mm circular SMD testpad; Manufacturer: Nordic Semiconductor; Manufacturer Part Number: N.A.; Part number NEMS: 100500477; Component Status: Active; Pad Count: 1; Part Number: TP_SMD_Ø1.5MM; PartId: 100500477; Component Class: Connectors; Author: rsk; ComponentLink1URL: N.A.; ComponentLink1Description: Datasheet; ComponentLink2URL: N.A.; ComponentLink2Description: Supplier link; HelpURL: N.A.; LatestRevisionDate: 2021-03-05; Published: 2016-06-02; Footprint Doc: TP_SMD_Ø1.5mm; Value: Ø1.5mm,SMD; Note: N.A.; Supplier 1: N.A.; Supplier Part Number 1: N.A.; Supplier 2: N.A.; Supplier Part Number 2: N.A.; Artikkelnr Noca: N.A.; Part number IPS: N.A.; Part number Norautron: N.A.
U1 = nRF54L15-QFAA-C00: Multi-protocol Bluetooth Low Energy, IEEE 802.15.4 and 2.4GHz proprietary Wireless MCU; Manufacturer: Nordic Semiconductor; Part number NEMS: 102000382; Component Status: Active; Pad Count: 49; Note: N.A.; Part Number: nRF54L15-QFAA-C00; PartId: 102000382; Component Class: Nordic_Devices; Author: stl1; Manufacturer Part Number: nRF54L15-QFAA-C00; ComponentLink1URL: N.A.; ComponentLink1Description: Datasheet; ComponentLink2URL: N.A.; ComponentLink2Description: Supplier link; HelpURL: N.A.; LatestRevisionDate: 2025-01-30; Published: 2025-01-30; Footprint Doc: QFN-48; Value: nRF54L15-QFAA-C00; Supplier 1: Nordic Semiconductor; Supplier Part Number 1: nRF54L15-QFAA-C00; Supplier 2: N.A.; Supplier Part Number 2: N.A.; Artikkelnr Noca: N.A.; Part number IPS: N.A.; Part number Norautron: N.A.
X1 = XTAL_SMD2012_32.768kHz_9pF_TXC: XTAL SMD 2012, 32.768kHz, 9pF, ±20ppm; Manufacturer: TXC Corporation; Manufacturer Part Number: 9HT11-32.768KDZC-T; Part number NEMS: 101600107; Component Status: Active; Pad Count: 2; Note: XTAL SMD 32.768kHz; Artikkelnr Noca: N.A.; Part Number: XTAL_SMD2012_32.768kHz_9pF_TXC; PartId: 101600107; Component Class: Oscillators; Author: eisk; ComponentLink1URL: http://www.txccrystal.com/images/pdf/9ht11.pdf; ComponentLink1Description: Datasheet; ComponentLink2URL: https://www.digikey.com/en/products/detail/9HT11-32.768KDZC-T/887-1426-1-ND/2403277; ComponentLink2Description: Supplier link; HelpURL: http://www.txccrystal.com/images/pdf/9ht11.pdf; LatestRevisionDate: 2023-03-14; Published: 2014-03-28; Footprint Doc: XTAL_2012; Value: 32.768kHz; Supplier 1: DigiKey; Supplier Part Number 1: 887-1426-2-ND; Supplier 2: Mouser; Supplier Part Number 2: 717-9HT11-32.7KDZC-T; Part number IPS: N.A.; Part number Norautron: N.A.
X2 = XTAL_SMD2016_32MHz_8pF_Kyocera: XTAL SMD 2016, 32MHz, Cl=8pF, Tot: ±40ppm; Manufacturer Part Number: CX2016DB32000D0WZRC1; Part number IPS: 00000007827; Part number Norautron: 26511136; Part number NEMS: 101600039; Component Status: Active; Pad Count: 4; Note: XTAL SMD 32.000MHz; Artikkelnr Noca: 22010022; Part Number: XTAL_SMD2016_32MHz_8pF_Kyocera; PartId: 101600039; Component Class: Oscillators; Author: rsk; Manufacturer: Kyocera; ComponentLink1URL: N.A.; ComponentLink1Description: Datasheet; ComponentLink2URL: N.A.; ComponentLink2Description: Supplier link; HelpURL: http://media.digikey.com/pdf/Data%20Sheets/AVX%20PDFs/CX2016DB32000D0WZRC1_Spec.pdf; LatestRevisionDate: 2016-06-02; Published: 2015-10-15; Footprint Doc: XTAL_2016; Value: 32MHz; Supplier 1: DigiKey; Supplier Part Number 1: 1253-1586-1-ND; Supplier 2: N.A.; Supplier Part Number 2: N.A.

## Sheet pca20072_rffe.SchDoc: nRF54L15 Tag - RFFE
size A4; Organization: Nordic Semiconductor; DocumentNumber: 3; Revision: 1.0.0; SheetNumber: 3; SheetTotal: 5; Author: RUBR; CompanyName: Nordic Semiconductor; DrawnBy: RUBR; DocumentSize: A4; ProjectName: nRF54L15-TAG
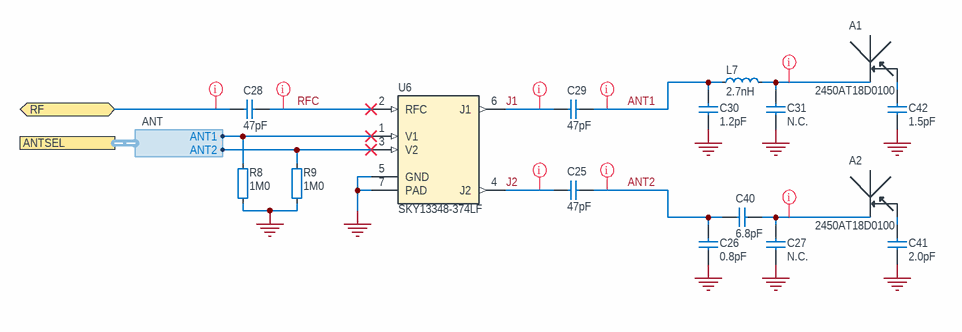
[diagram p2: pca20072_rffe.SchDoc]

### Parts
A1  2450AT18D0100  [2450AT18D0100_TE-R]
A2  2450AT18D0100  [2450AT18D0100_TE-L]
C25  47pF  [CAPC0603X03L_C]
C26  0.8pF  [CAPC1005X04L_C2]
C27  N.C.  [CAPC1005X04L_C2]
C28  47pF  [CAPC0603X03L_C]
C29  47pF  [CAPC0603X03L_C]
C30  1.2pF  [CAPC1005X04L_C2]
C31  N.C.  [CAPC1005X04L_C2]
C40  6.8pF  [CAPC1005X04L_C2]
C41  2.0pF  [CAPC1005X04L_C2]
C42  1.5pF  [CAPC1005X04L_C2]
L7  2.7nH  [INDC1005X04L_C2]
R8  1M0  [RESC0603X03L_C]
R9  1M0  [RESC0603X03L_C]
U6  SKY13348-374LF  [SON50P150X50_HS-7N]

### Ports
ANTSEL (harness ANT), RF (bidir)

### Harnesses
ANT: ANT2, ANT1

### Nets
GND: A1.2(GND) A2.2(GND) C26.1 C27.1 C30.1 C31.1 C41.1 C42.1 R8.1 R9.1 U6.5(GND) U6.7(PAD)
ANT1: C29.1 C30.2 L7.1
ANT2: C25.1 C26.2 C40.1
J1: C29.2 U6.6(J1)
J2: C25.2 U6.4(J2)
P1.09: R8.2 U6.1(V1) ; port ANTSEL.ANT1
P1.10: R9.2 U6.3(V2) ; port ANTSEL.ANT2
RF: C28.2 ; port RF
RFC: C28.1 U6.2(RFC)
NetA1_1: A1.1 C31.2 L7.2
NetA1_3: A1.3(Tuning) C42.2
NetA2_1: A2.1 C27.2 C40.2
NetA2_3: A2.3(Tuning) C41.2

### Layout directives
net class RF: ANT1, ANT2, J1, J2, NetA1_1, NetA2_1, RF, RFC

### Notes on the sheet
- Title
- Size
- Date:
- File:
- A4
- PCB Assembly Number
- Sheet
- Drawn By:
- Revision
- of
- Classification:

### Library data of the parts
A1 A2 = Johanson 2450AT18D0100_TE: 2.45 GHz chip antenna; Manufacturer: Johanson Technology; Part number IPS: 00000001415; Part number NEMS: 100700004, 100700005, 100700006; Component Status: Active; Pad Count: 4; Note: N.A.; Artikkelnr Noca: 53059035; Part Number: Johanson 2450AT18D0100_TE; PartId: 100700006; Component Class: Antennas; Author: rsk; Manufacturer Part Number: 2450AT18D0100; ComponentLink1URL: N.A.; ComponentLink1Description: Datasheet; ComponentLink2URL: N.A.; ComponentLink2Description: Supplier link; HelpURL: http://www.johansontechnology.com/datasheets/antennas/2450AT18D0100.pdf; LatestRevisionDate: 2025-01-07; Published: 2016-01-12; Footprint Doc: 2450AT18D0100; Value: 2450AT18D0100; Supplier 1: DigiKey; Supplier Part Number 1: 2450AT18D0100E; Supplier 2: Mouser; Supplier Part Number 2: 609-2450AT18D0100E; Part number Norautron: N.A.
C25 C28 C29 = C0201-47p-25V-NP0-QLCD250Q470G1GV001T: Capacitor, High Q, Low Loss, C0G/NP0, 25V, ±2%, -55°C ~ 125°C; Manufacturer: Johanson Technology; Part number IPS: 00000010810; Component Status: Active; Pad Count: 2; Artikkelnr Noca: N.A.; Part Number: C0201-47p-25V-NP0-QLCD250Q470G1GV001T; Component Class: Capacitors; Author: rubr; Manufacturer Part Number: QLCD250Q470G1GV001T; ComponentLink1URL: https://www.johansontechnology.com/search/pn-pdf/QLCD250Q470G1GV001T/; ComponentLink1Description: Datasheet; ComponentLink2URL: https://www.digikey.com/en/products/detail/johanson-technology-inc/QLCD250Q470G1GV001T/1561502; ComponentLink2Description: Supplier link; HelpURL: https://www.johansontechnology.com/products/rf-capacitors/high-q-multilayer-capacitors/0201-lseries/; LatestRevisionDate: 2026-04-13; Published: 2026-04-13; Footprint Doc: 0201; Value: 47pF; Note: 25V; Supplier 1: DigiKey; Supplier Part Number 1: 712-QLCD250Q470G1GV001TCT-ND; Supplier 2: N.A.; Supplier Part Number 2: N.A.; Part number Norautron: N.A.
C26 = C0402-0.8p: Capacitor, NP0, ±5%; Manufacturer: Murata; Manufacturer Part Number: GRM1555C1HR80WA01D; Part number IPS: 00000007782; Part number Norautron: N.A.; Part number NEMS: 100200116; Component Status: Active; Pad Count: 2; Note: 50V; Artikkelnr Noca: 20029147; Part Number: C0402-0.8p; PartId: 100200116; Component Class: Capacitors; Author: rsk; ComponentLink1URL: https://www.murata.com/~/media/webrenewal/support/library/catalog/products/capacitor/mlcc/c02e.ashx?la=en-us; ComponentLink1Description: Datasheet; ComponentLink2URL: N.A.; ComponentLink2Description: Supplier link; HelpURL: N.A.; LatestRevisionDate: 2012-11-21; Published: 2009-05-08; Footprint Doc: 0402; Value: 0.8pF; Supplier 1: DigiKey; Supplier Part Number 1: 490-6270-1-ND; Supplier 2: N.A.; Supplier Part Number 2: N.A.
C27 C31 = C0402-N.C.: Not mounted; Manufacturer: N.A.; Part number NEMS: 100200105; Component Status: Active; Pad Count: 2; Note: Chip Cap; Assembly: Not mounted; Part Number: C0402-N.C.; PartId: 100200105; Component Class: Capacitors; Author: rsk; Manufacturer Part Number: N.A.; ComponentLink1URL: N.A.; ComponentLink1Description: Datasheet; ComponentLink2URL: N.A.; ComponentLink2Description: Supplier link; HelpURL: N.A.; LatestRevisionDate: 2009-05-08; Published: 2009-05-08; Footprint Doc: 0402; Value: N.C.; Supplier 1: N.A.; Supplier Part Number 1: N.A.; Supplier 2: N.A.; Supplier Part Number 2: N.A.; Artikkelnr Noca: N.A.; Part number IPS: N.A.; Part number Norautron: N.A.
C30 = C0402-1.2p: Capacitor, NP0, ±0.1pF; Manufacturer: N.A.; Part number IPS: 00000005410; Part number NEMS: 100200119; Component Status: Active; Pad Count: 2; Note: 50V; Artikkelnr Noca: 20029157; Part Number: C0402-1.2p; PartId: 100200119; Component Class: Capacitors; Author: rsk; Manufacturer Part Number: N.A.; ComponentLink1URL: N.A.; ComponentLink1Description: Datasheet; ComponentLink2URL: N.A.; ComponentLink2Description: Supplier link; HelpURL: N.A.; LatestRevisionDate: 2011-05-11; Published: 2009-05-08; Footprint Doc: 0402; Value: 1.2pF; Supplier 1: N.A.; Supplier Part Number 1: N.A.; Supplier 2: N.A.; Supplier Part Number 2: N.A.; Part number Norautron: N.A.
C40 = C0402-6.8p-50V-NP0-GJM1555C1H6R8BB01D: Capacitor, High Q, Low Loss, C0G/NP0, 50V, ±0.1pF, -55°C ~ 125°C; Manufacturer: Murata; Part number IPS: 80000004966; Component Status: Active; Pad Count: 2; Artikkelnr Noca: N.A.; Part Number: C0402-6.8p-50V-NP0-GJM1555C1H6R8BB01D; Component Class: Capacitors; Author: rubr; Manufacturer Part Number: GJM1555C1H6R8BB01D; ComponentLink1URL: https://search.murata.co.jp/Ceramy/image/img/A01X/G101/ENG/GJM1555C1H6R8BB01-01.pdf; ComponentLink1Description: Datasheet; ComponentLink2URL: https://www.digikey.com/en/products/detail/murata-electronics/GJM1555C1H6R8BB01D/2593097; ComponentLink2Description: Supplier link; HelpURL: https://pim.murata.com/en-global/pim/details/?partNum=GJM1555C1H6R8BB01%23; LatestRevisionDate: 2026-04-13; Published: 2026-04-13; Footprint Doc: 0402; Value: 6.8pF; Note: 50V; Supplier 1: DigiKey; Supplier Part Number 1: 490-12599-1-ND; Supplier 2: N.A.; Supplier Part Number 2: N.A.; Part number Norautron: N.A.
C41 = C0402-2.0p-50V-NP0-GJM1555C1H2R0BB01: Capacitor, High Q, Low Loss, C0G/NP0, 50V, ±0.1pF, -55°C ~ 125°C; Manufacturer: Murata; Part number IPS: 80000004957; Part number NEMS: 100200697; Component Status: Active; Pad Count: 2; Artikkelnr Noca: N.A.; Part Number: C0402-2.0p-50V-NP0-GJM1555C1H2R0BB01; Component Class: Capacitors; Author: rubr; Manufacturer Part Number: GJM1555C1H2R0BB01; ComponentLink1URL: https://search.murata.co.jp/Ceramy/image/img/A01X/G101/ENG/GJM1555C1H2R0BB01-01.pdf; ComponentLink1Description: Datasheet; ComponentLink2URL: https://www.digikey.com/en/products/detail/murata-electronics/GJM1555C1H2R0BB01D/2592912; ComponentLink2Description: Supplier link; HelpURL: https://pim.murata.com/en-global/pim/details/?partNum=GJM1555C1H2R0BB01%23; LatestRevisionDate: 2026-04-13; Published: 2025-04-23; Footprint Doc: 0402; Value: 2.0pF; Note: 50V; Supplier 1: DigiKey; Supplier Part Number 1: 490-8091-1-ND; Supplier 2: N.A.; Supplier Part Number 2: N.A.; Part number Norautron: N.A.; PartId: 100200697
C42 = C0402-1.5p-50V-NP0-GJM1555C1H1R5BB01D: Capacitor, High Q, Low Loss, C0G/NP0, 50V, ±0.1pF, -55°C ~ 125°C; Manufacturer: Murata; Part number IPS: 80000004967; Component Status: Active; Pad Count: 2; Artikkelnr Noca: N.A.; Part Number: C0402-1.5p-50V-NP0-GJM1555C1H1R5BB01D; Component Class: Capacitors; Author: rubr; Manufacturer Part Number: GJM1555C1H1R5BB01D; ComponentLink1URL: https://search.murata.co.jp/Ceramy/image/img/A01X/G101/ENG/GJM1555C1H1R5BB01-01.pdf; ComponentLink1Description: Datasheet; ComponentLink2URL: https://www.digikey.com/en/products/detail/murata-electronics/GJM1555C1H1R5BB01D/2592887; ComponentLink2Description: Supplier link; HelpURL: https://pim.murata.com/en-global/pim/details/?partNum=GJM1555C1H1R5BB01%23; LatestRevisionDate: 2026-04-13; Published: 2026-04-13; Footprint Doc: 0402; Value: 1.5pF; Note: 50V; Supplier 1: DigiKey; Supplier Part Number 1: 490-8087-1-ND; Supplier 2: N.A.; Supplier Part Number 2: N.A.; Part number Norautron: N.A.
L7 = L0402-2n7-Multilayer_Murata: Inductor, 800mA, ±2%, 120mΩ; Manufacturer: Murata; Manufacturer Part Number: LQG15HS2N7B02D; Part number NEMS: 100300445; Component Status: Active; Pad Count: 2; Note: -55°C ~ 125°C; Artikkelnr Noca: N.A.; Part Number: L0402-2n7-Multilayer_Murata; PartId: 100300445; Component Class: Inductors; Author: hany; ComponentLink1URL: https://search.murata.co.jp/Ceramy/image/img/P02/JELF243B-0010.pdf; ComponentLink1Description: Datasheet; ComponentLink2URL: N.A.; ComponentLink2Description: Supplier link; HelpURL: https://search.murata.co.jp/Ceramy/image/img/P02/JELF243B-0010.pdf; LatestRevisionDate: 2023-06-06; Published: 2023-06-06; Footprint Doc: 0402; Value: 2.7nH; Supplier 1: DigiKey; Supplier Part Number 1: 490-LQG15HS2N7B02DTR-ND; Supplier 2: Mouser; Supplier Part Number 2: 81-LQG15HS2N7B02D; Part number IPS: N.A.; Part number Norautron: N.A.
R8 R9 = R0201-1M0: Resistor, ±1%, 0.05W; Manufacturer: N.A.; Part number IPS: 00000001418; Part number Norautron: 26107108; Part number NEMS: 100100093; Component Status: Active; Pad Count: 2; Note: Chip Res 1%; Part Number: R0201-1M0; PartId: 100100093; Component Class: Resistors; Author: rsk; Manufacturer Part Number: N.A.; ComponentLink1URL: N.A.; ComponentLink1Description: Datasheet; ComponentLink2URL: N.A.; ComponentLink2Description: Supplier link; HelpURL: N.A.; LatestRevisionDate: 2014-11-13; Published: 2014-11-13; Footprint Doc: 0201; Value: 1M0; Supplier 1: N.A.; Supplier Part Number 1: N.A.; Supplier 2: N.A.; Supplier Part Number 2: N.A.; Artikkelnr Noca: N.A.
U6 = SKY13348-374LF: 50 MHz-6.0 GHz GaAs SPDT Switch; Manufacturer: Skyworks; Part number NEMS: 101900872; Component Status: Active; Pad Count: 6; Note: N.A.; Part Number: SKY13348-374LF; PartId: 101900872; Component Class: Misc_ICs; Author: rubr; Manufacturer Part Number: SKY13348-374LF; ComponentLink1URL: https://www.skyworksinc.com/-/media/E9327268CB16479EBC64472424698E70.pdf; ComponentLink1Description: Datasheet; ComponentLink2URL: https://www.digikey.com/en/products/detail/skyworks-solutions-inc/SKY13348-374LF/2658308; ComponentLink2Description: Supplier link; HelpURL: https://www.skyworksinc.com/Products/Switches/SKY13348-374LF; LatestRevisionDate: 2025-04-09; Published: 2025-04-09; Footprint Doc: XFDFN-6; Value: SKY13348-374LF; Supplier 1: DigiKey; Supplier Part Number 1: 863-1335-1-ND; Supplier 2: N.A.; Supplier Part Number 2: N.A.; Artikkelnr Noca: N.A.; Part number IPS: N.A.; Part number Norautron: N.A.